# EasyEDA schematic SCH_Abraxas_doable_2026-10-19.json
TITLE: PCB - full; REV: 3.2; Date: 2026-07-11; Sheet: 1/1; Drawn By: Isao Perregaux; Company: Abraxas
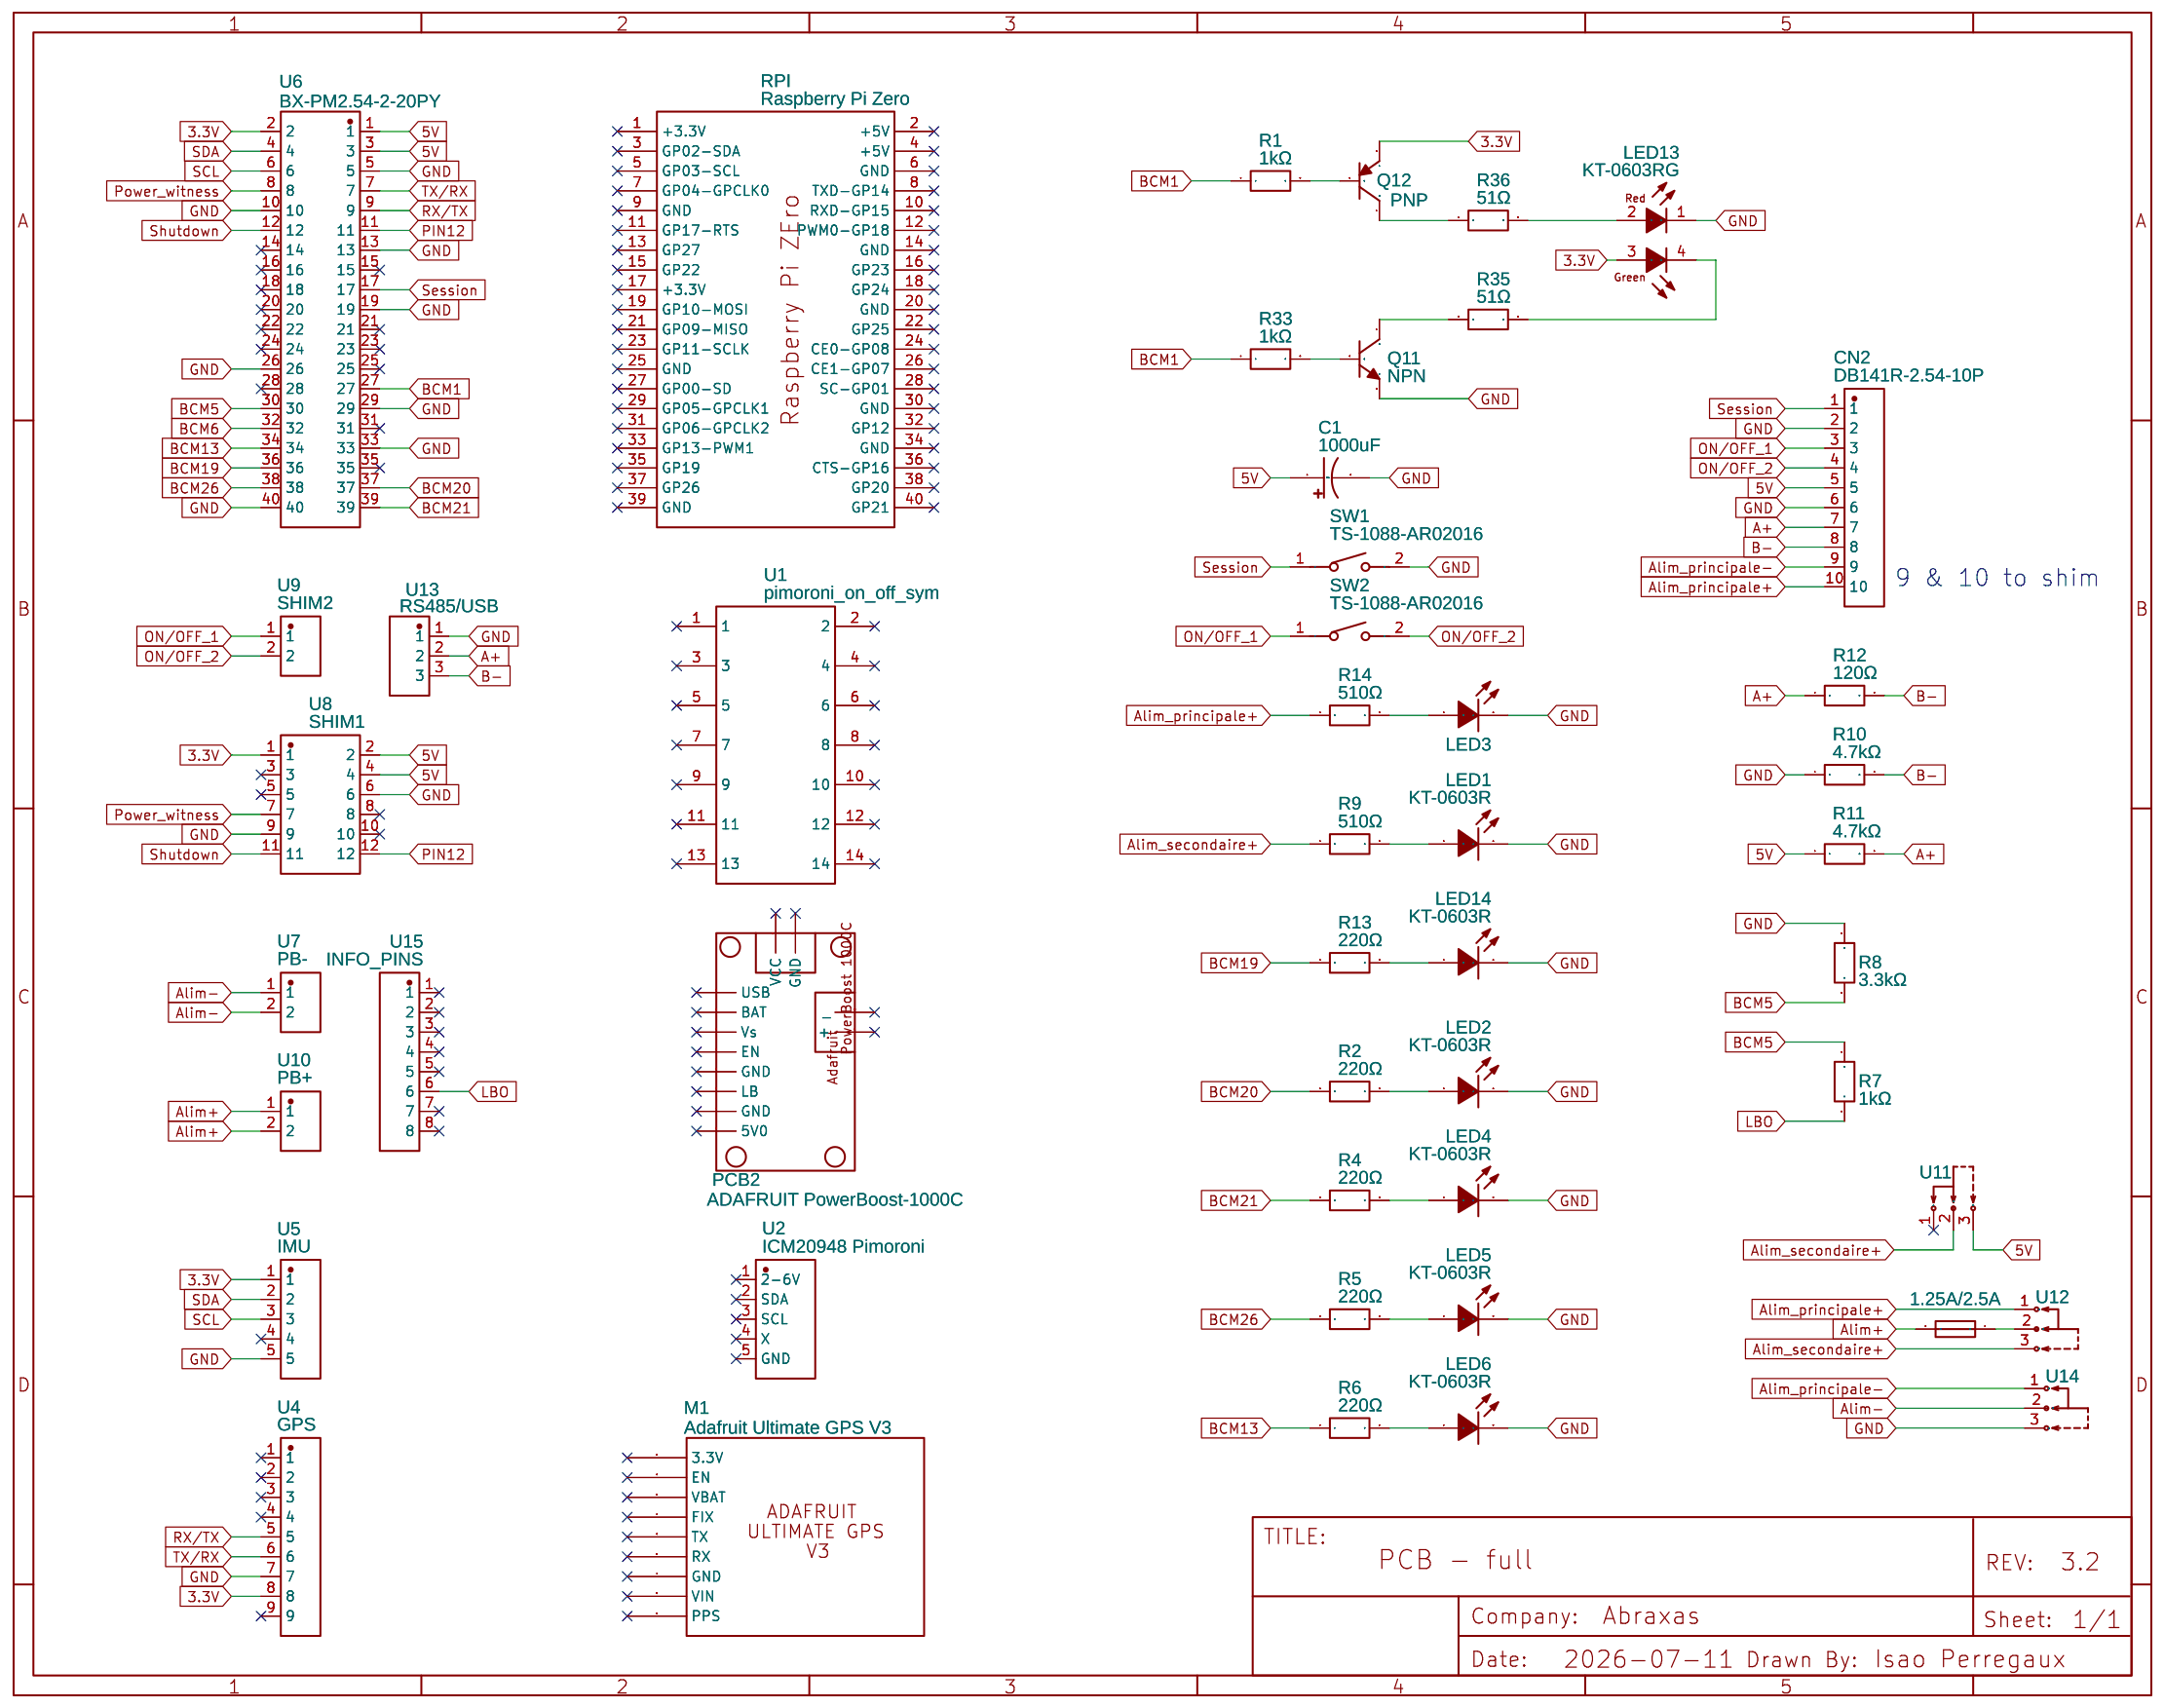
[diagram p0: schematic sheet]

## Parts
C1  1000uF  [CAP-TH_BD8.0-P3.50-D0.6-FD]
CN2  DB141R-2.54-10P  [CONN-TH_10P-P2.54_DIBO_DB141R-2.54-10P]
F1  1.25A/2.5A  [F1812]
LED1  KT-0603R  [LED-SMD_L1.6-W0.8-R-RD]
LED2  KT-0603R  [LED-SMD_L1.6-W0.8-R-RD]
LED3  KT-0603R  [LED-SMD_L1.6-W0.8-R-RD]
LED4  KT-0603R  [LED-SMD_L1.6-W0.8-R-RD]
LED5  KT-0603R  [LED-SMD_L1.6-W0.8-R-RD]
LED6  KT-0603R  [LED-SMD_L1.6-W0.8-R-RD]
LED13  KT-0603RG  [LED-SMD_4P-L1.6-W1.5_KT-0603RG]
LED14  KT-0603R  [LED-SMD_L1.6-W0.8-R-RD]
M1  Adafruit Ultimate GPS V3  [ADAFRUIT ULTIMATE GPS BREAKOUT V3]
PCB2  ADAFRUIT PowerBoost-1000C  [POWERBOOST 1000C]
Q11  NPN  [TO-92-3_L4.8-W3.7-P1.27-R-1]
Q12  PNP  [TO-92-3_L4.9-W3.7-P1.27-L]
R1  1kΩ  [R0603]
R2  220Ω  [R0603]
R4  220Ω  [R0603]
R5  220Ω  [R0603]
R6  220Ω  [R0603]
R7  1kΩ  [R0603]
R8  3.3kΩ  [R0603]
R9  510Ω  [R0603]
R10  4.7kΩ  [R0603]
R11  4.7kΩ  [R0603]
R12  120Ω  [R0603]
R13  220Ω  [R0603]
R14  510Ω  [R0603]
R33  1kΩ  [R0603]
R35  51Ω  [R0603]
R36  51Ω  [R0603]
RPI  Raspberry Pi Zero  [RASPBERRY_PI_ZERO]
SW1  TS-1088-AR02016  [SW-SMD_L3.9-W3.0-P4.45]
SW2  TS-1088-AR02016  [SW-SMD_L3.9-W3.0-P4.45]
U1  pimoroni_on_off_sym  [PIMORONI_ON_OFF_SHIM]
U2  ICM20948 Pimoroni  [BME280_PIMORONI]
U4  GPS  [HDR-TH_9P-P2.54-V-F-4]
U5  IMU  [HDR-TH_5P-P2.54-V-F-B]
U6  BX-PM2.54-2-20PY  [HDR-TH_40P-P2.54-V-F-R2-C20-S2.54]
U7  PB-  [HDR-TH_2P-P2.54-V-F-1]
U8  SHIM1  [HDR-TH_12P-P2.54-V-F-R2-C6-S2.54]
U9  SHIM2  [HDR-TH_2P-P2.54-V-F-1]
U10  PB+  [HDR-TH_2P-P2.54-V-F-1]
U11  SS12D10G5  [SW-TH_SHOU-HAN_SS12D10G4]
U12  SS12D10G5  [SW-TH_SHOU-HAN_SS12D10G4]
U13  RS485/USB  [HDR-TH_3P-P2.54-V-F]
U14  SS12D10G5  [SW-TH_SHOU-HAN_SS12D10G4]
U15  INFO_PINS  [HDR-TH_8P-P2.54-V-F]

## Library data of the parts
C1 = ULR108M1AF1ACBX1CR: Contributor: LCSC; Supplier: LCSC; Supplier Part: C248439; Manufacturer: MAN YUE(万裕科技); Manufacturer Part: ULR108M1AF1ACB; JLCPCB Part Class: Extended Part
CN2 = DB141R-2.54-10P: Contributor: LCSC; Supplier: LCSC; Supplier Part: C2898762; Manufacturer: DORABO(地博电气); Manufacturer Part: DB141R-2.54-10P-GN; JLCPCB Part Class: Extended Part
F1 = MINISMDC125F/16-2: Contributor: LCSC; Supplier: LCSC; Supplier Part: C15156; Manufacturer: Littelfuse(美国力特); JLCPCB Part Class: Extended Part
LED1-LED6 LED14 = KT-0603R: Supplier: LCSC; Manufacturer: KENTO; Supplier Part: C2286; JLCPCB Part Class: Basic Part
LED13 = KT-0603RG: Supplier: LCSC; Manufacturer: KENTO; Manufacturer Part: KT-0603RYG; Supplier Part: C24477; JLCPCB Part Class: Extended Part
M1 = Adafruit_Ultimate_GPS_V3: Supplier: Mouser; Contributor: alexisv
PCB2 = ADAFRUIT PowerBoost-1000C: sourceId: QHlyZemsx; Mounted: No; Contributor: JamesBatten
Q11 = BC547BBU: Contributor: LCSC; Supplier: LCSC; Supplier Part: C896669; Manufacturer: onsemi(安森美); JLCPCB Part Class: Extended Part
Q12 = BC557C: Contributor: LCSC; Supplier: LCSC; Supplier Part: C713618; Manufacturer: LGE(鲁光); JLCPCB Part Class: Extended Part
R1 R7 R33 = FRC0603F1001TS: Contributor: lcsc; Supplier: LCSC; Supplier Part: C2907002; Manufacturer: FOJAN(富捷); JLCPCB Part Class: Extended Part
R2 R4-R6 R13 = FRC0603F2200TS: Supplier: LCSC; Supplier Part: C2907014; Manufacturer: FOJAN(富捷); Contributor: lcsc; JLCPCB Part Class: Extended Part
R8 = FRC0603F3301TS: Contributor: lcsc; Supplier: LCSC; Supplier Part: C2907023; Manufacturer: FOJAN(富捷); JLCPCB Part Class: Extended Part
R9 R14 = FRC0603F5100TS: Supplier: LCSC; Supplier Part: C2907048; Manufacturer: FOJAN(富捷); JLCPCB Part Class: Extended Part; Contributor: lcsc
R10 R11 = FRC0603F4701TS: Contributor: LCSC; Supplier: LCSC; Supplier Part: C2907034; Manufacturer: FOJAN(富捷); JLCPCB Part Class: Extended Part
R12 = FRC0603F1200TS: Contributor: lcsc; Supplier: LCSC; Supplier Part: C2906988; Manufacturer: FOJAN(富捷); JLCPCB Part Class: Extended Part
R35 R36 = FRC0603F51R0TS: Contributor: LCSC; Supplier: LCSC; Supplier Part: C2907050; Manufacturer: FOJAN(富捷); JLCPCB Part Class: Extended Part
RPI = Raspberry Pi Zero: Contributor: mohsenmirzaie790; sourceId: XYSa4mEWQ; Manufacturer Part: Raspberry Pi Zero WH; Supplier: Pollin; Supplier Part: 810885; Manufacturer: Raspberry Pi Foundation; link: https://www.pollin.de/p/raspberry-pi-zero-wh-mit-bestuecktem-header-810885
SW1 SW2 = TS-1088-AR02016: Contributor: LCSC; Supplier: LCSC; Supplier Part: C720477; Manufacturer: XUNPU(讯普); JLCPCB Part Class: Basic Part
U1 = pimoroni_on_off_sym: Contributor: espenrog
U2 = BME280_PIMORONI: Supplier Part: C50951; Manufacturer: ReliaPro; Manufacturer Part: 2.54mm 1*5P Header; Contributor: axelvendeville.v2
U4 = BX-PM2.54-1-9PY: Supplier: LCSC; Supplier Part: C49326044; Manufacturer: Bossie(博锡); JLCPCB Part Class: Extended Part; Contributor: lcsc
U5 = BX-PM2.54-1-5PY: Supplier: LCSC; Supplier Part: C18078128; Manufacturer: Bossie(博锡); Contributor: lcsc; JLCPCB Part Class: Extended Part
U6 = BX-PM2.54-2-20PY: Supplier: LCSC; Supplier Part: C18078157; Manufacturer: Bossie(博锡); Contributor: lcsc; JLCPCB Part Class: Extended Part
U7 U9 U10 = BX-PM2.54-1-2PY: Supplier: LCSC; Supplier Part: C18078125; Manufacturer: Bossie(博锡); Contributor: lcsc; JLCPCB Part Class: Extended Part
U8 = BX-PM2.54-2-6PY: Supplier: LCSC; Supplier Part: C18078145; Manufacturer: Bossie(博锡); Contributor: lcsc; JLCPCB Part Class: Extended Part
U11 U12 U14 = SS12D10G5: Supplier: LCSC; Supplier Part: C7431054; Manufacturer: SHOU HAN(首韩); JLCPCB Part Class: Extended Part; Contributor: lcsc
U13 = BX-PM2.54-1-3PY: Supplier: LCSC; Supplier Part: C18078126; Manufacturer: Bossie(博锡); Contributor: lcsc; JLCPCB Part Class: Extended Part
U15 = BX-PM2.54-1-8PY: Supplier: LCSC; Supplier Part: C18078131; Manufacturer: Bossie(博锡); Contributor: lcsc; JLCPCB Part Class: Extended Part

## Nets
3.3V: LED13.3(A) Q12.3(E) U4.8 U5.1 U6.2 U8.1
5V: C1.1 CN2.5 R11.1 U6.1 U6.3 U8.2 U8.4 U11.3
GND: C1.2 CN2.2 CN2.6 LED1.2(K) LED2.2(K) LED3.2(K) LED4.2(K) LED5.2(K) LED6.2(K) LED13.1(C) LED14.2(K) Q11.3(E) R8.1 R10.1 SW1.2 U4.7 U5.5 U6.5 U6.10 U6.13 U6.19 U6.26 U6.29 U6.33 U6.40 U8.6 U8.9 U13.1 U14.3
A+: CN2.7 R11.2 R12.1 U13.2
Alim+: F1.2 U10.1 U10.2
Alim-: U7.1 U7.2 U14.2
Alim_principale+: CN2.10 R14.1 U12.1
Alim_principale-: CN2.9 U14.1
Alim_secondaire+: R9.1 U11.2 U12.3
B-: CN2.8 R10.2 R12.2 U13.3
BCM1: R1.1 R33.1 U6.27
BCM5: R7.1 R8.2 U6.30
BCM6: U6.32
BCM13: R6.1 U6.34
BCM19: R13.1 U6.36
BCM20: R2.1 U6.37
BCM21: R4.1 U6.39
BCM26: R5.1 U6.38
LBO: R7.2 U15.6
ON/OFF_1: CN2.3 SW2.1 U9.1
ON/OFF_2: CN2.4 SW2.2 U9.2
PIN12: U6.11 U8.12
Power_witness: U6.8 U8.7
RX/TX: U4.5 U6.9
SCL: U5.3 U6.6
SDA: U5.2 U6.4
Session: CN2.1 SW1.1 U6.17
Shutdown: U6.12 U8.11
TX/RX: U4.6 U6.7
Net-(F1-1): F1.1 U12.2
Net-(LED1-1): LED1.1(A) R9.2
Net-(LED2-1): LED2.1(A) R2.2
Net-(LED3-1): LED3.1(A) R14.2
Net-(LED4-1): LED4.1(A) R4.2
Net-(LED5-1): LED5.1(A) R5.2
Net-(LED6-1): LED6.1(A) R6.2
Net-(LED13-2): LED13.2(A) R36.2
Net-(LED13-4): LED13.4(C) R35.2
Net-(LED14-1): LED14.1(A) R13.2
Net-(Q11-1): Q11.1(C) R35.1
Net-(Q11-2): Q11.2(B) R33.2
Net-(Q12-1): Q12.1(C) R36.1
Net-(Q12-2): Q12.2(B) R1.2

Not connected (* = marked no-connect by the designer): M1 1(3.3V)* 2(EN)* 3(VBAT)* 4(FIX)* 5(TX)* 6(RX)* 7(GND)* 8(VIN)* 9(PPS)*; PCB2 1(USB)* 2(BAT)* 3(Vs)* 4(EN)* 5(GND)* 6(LB)* 7(GND)* 8(5V0)* 9(+)* 10(_)*; RPI 1(+3.3V)* 2(+5V)* 3(GP02-SDA)* 4(+5V)* 5(GP03-SCL)* 6(GND)* 7(GP04-GPCLK0)* 8(TXD-GP14)* 9(GND)* 10(RXD-GP15)* 11(GP17-RTS)* 12(PWM0-GP18)* 13(GP27)* 14(GND)* 15(GP22)* 16(GP23)* 17(+3.3V)* 18(GP24)* 19(GP10-MOSI)* 20(GND)* 21(GP09-MISO)* 22(GP25)* 23(GP11-SCLK)* 24(CE0-GP08)* 25(GND)* 26(CE1-GP07)* 27(GP00-SD)* 28(SC-GP01)* 29(GP05-GPCLK1)* 30(GND)* 31(GP06-GPCLK2)* 32(GP12)* 33(GP13-PWM1)* 34(GND)* 35(GP19)* 36(CTS-GP16)* 37(GP26)* 38(GP20)* 39(GND)* 40(GP21)*; U1 1* 2* 3* 4* 5* 6* 7* 8* 9* 10* 11* 12* 13* 14*; U2 1(2-6V)* 2(SDA)* 3(SCL)* 4(X)* 5(GND)*; U4 1* 2* 3* 4* 9*; U5 4*; U6 14* 15* 16* 18* 20* 21* 22* 23* 24* 25* 28* 31* 35*; U8 3* 5* 8* 10*; U11 1*; U15 1* 2* 3* 4* 5* 7* 8*

## Notes on the sheet
- 9 & 10 to shim
